# Altium schematic sheet 02_Analog.SchDoc
size A3
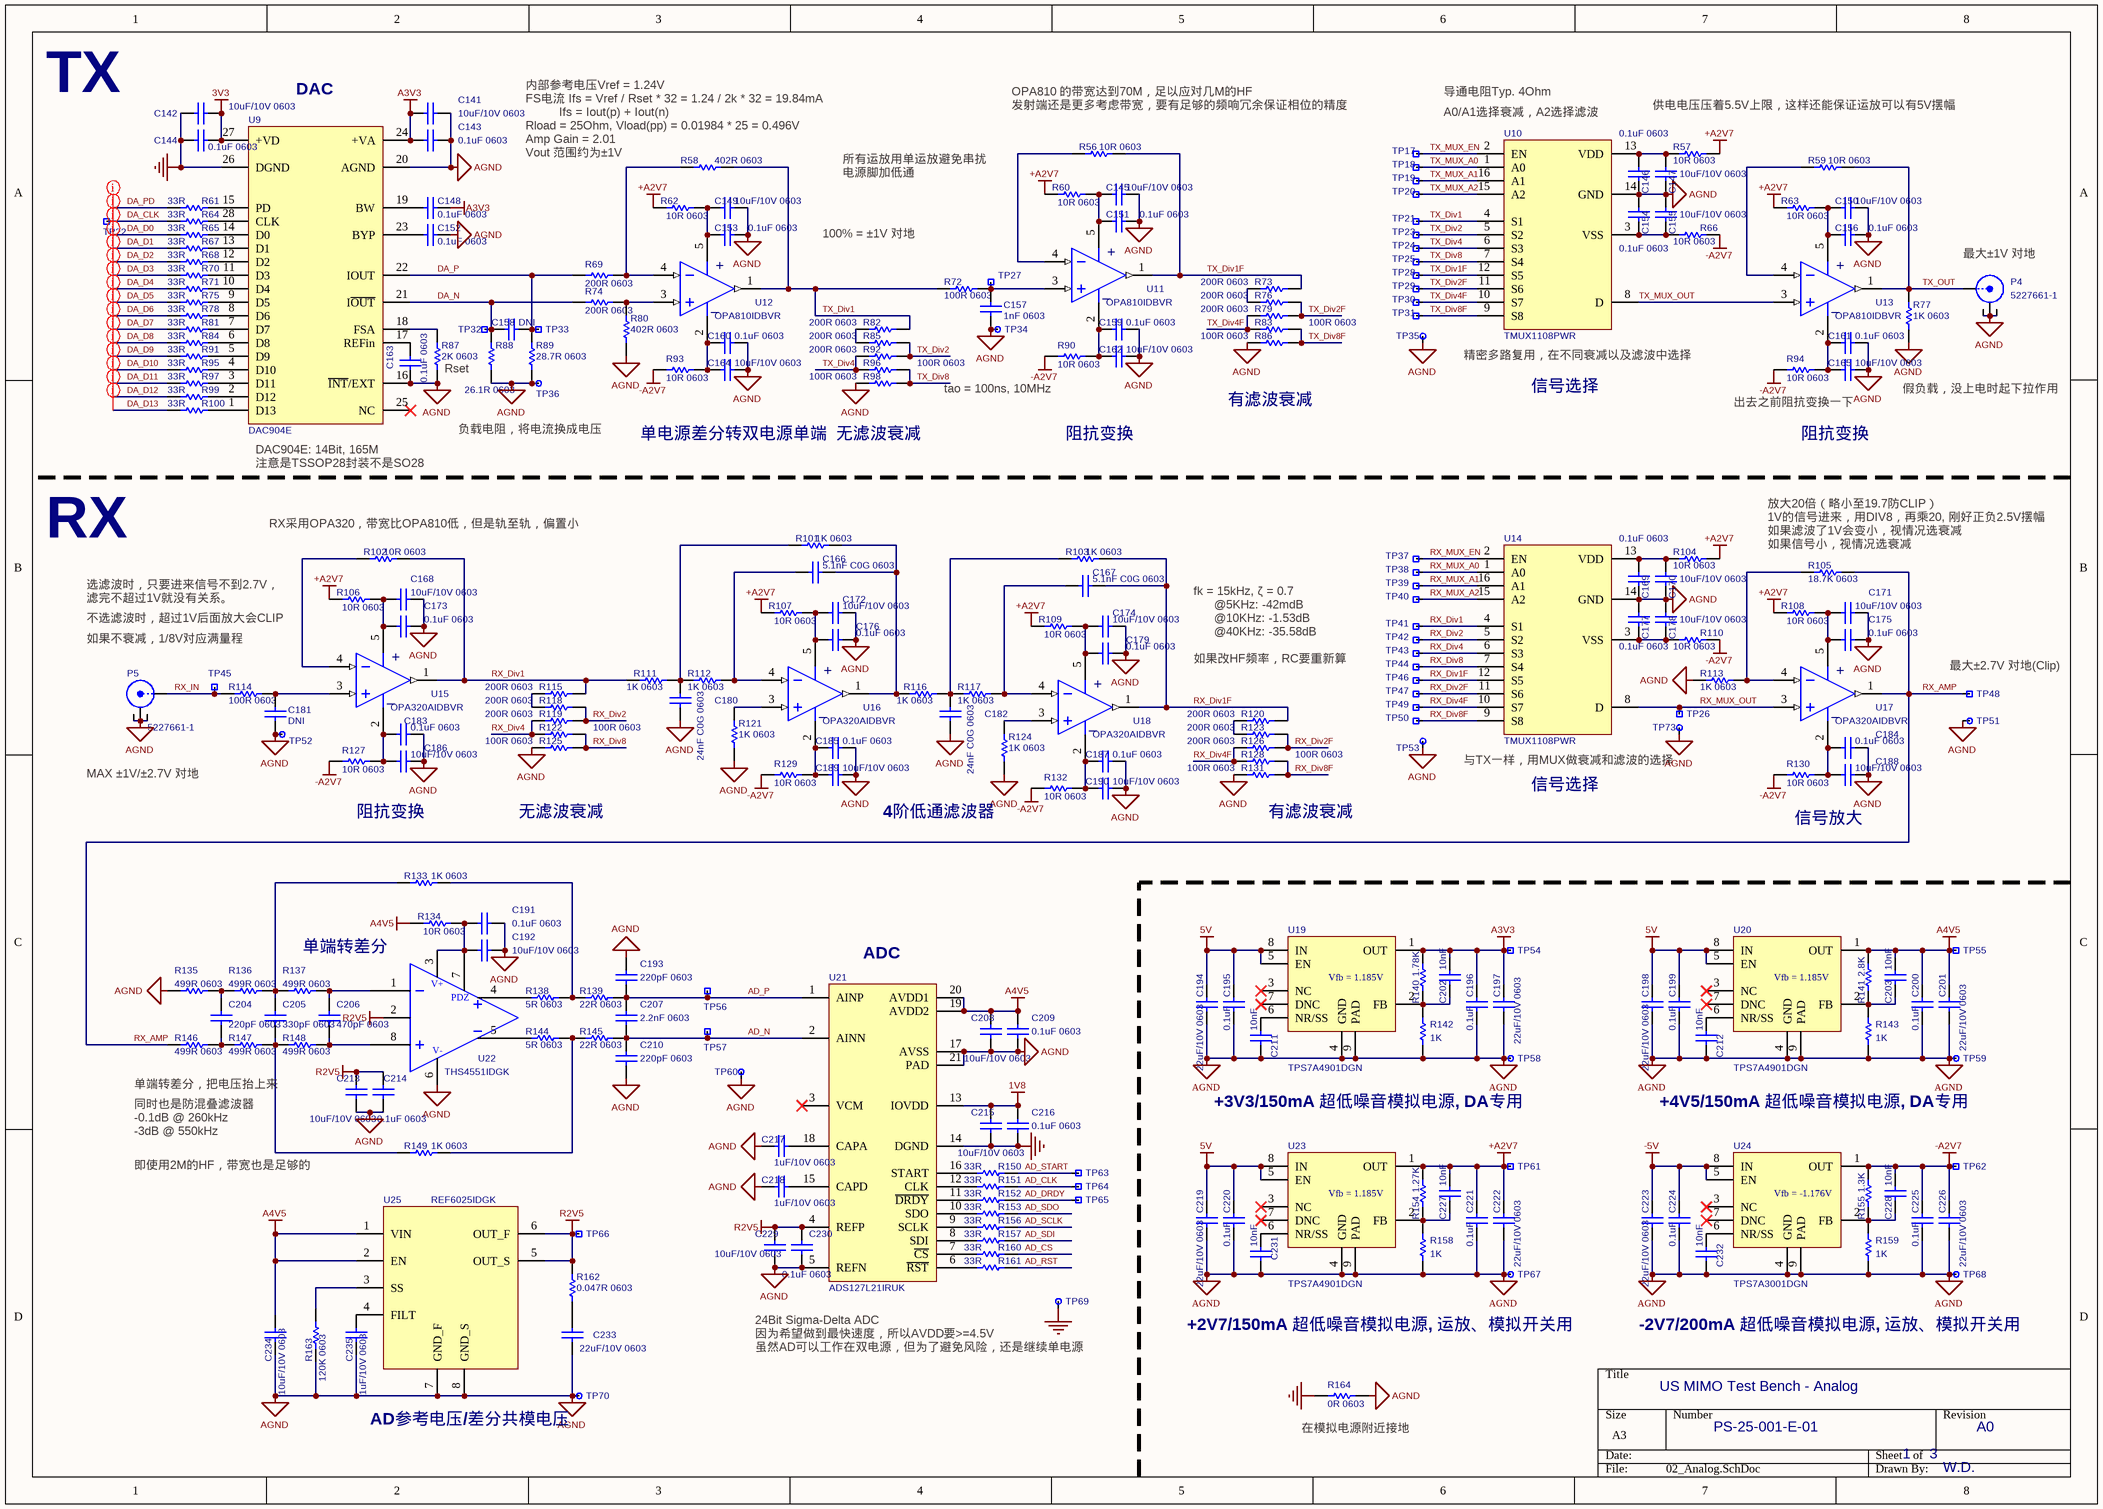
[diagram p0: 02_Analog.SchDoc]

## Parts
C141  10uF/10V 0603  [1608[0603]CAP]
C142  10uF/10V 0603  [1608[0603]CAP]
C143  0.1uF 0603  [1608[0603]CAP]
C144  0.1uF 0603  [1608[0603]CAP]
C145  10uF/10V 0603  [1608[0603]CAP]
C146  0.1uF 0603  [1608[0603]CAP]
C147  10uF/10V 0603  [1608[0603]CAP]
C148  0.1uF 0603  [1608[0603]CAP]
C149  10uF/10V 0603  [1608[0603]CAP]
C150  10uF/10V 0603  [1608[0603]CAP]
C151  0.1uF 0603  [1608[0603]CAP]
C152  0.1uF 0603  [1608[0603]CAP]
C153  0.1uF 0603  [1608[0603]CAP]
C154  0.1uF 0603  [1608[0603]CAP]
C155  10uF/10V 0603  [1608[0603]CAP]
C156  0.1uF 0603  [1608[0603]CAP]
C157  1nF 0603  [1608[0603]CAP]
C158  DNI  [1608[0603]CAP]
C159  0.1uF 0603  [1608[0603]CAP]
C160  0.1uF 0603  [1608[0603]CAP]
C161  0.1uF 0603  [1608[0603]CAP]
C162  10uF/10V 0603  [1608[0603]CAP]
C163  0.1uF 0603  [1608[0603]CAP]
C164  10uF/10V 0603  [1608[0603]CAP]
C165  10uF/10V 0603  [1608[0603]CAP]
C166  5.1nF C0G 0603  [1608[0603]CAP]
C167  5.1nF C0G 0603  [1608[0603]CAP]
C168  10uF/10V 0603  [1608[0603]CAP]
C169  0.1uF 0603  [1608[0603]CAP]
C170  10uF/10V 0603  [1608[0603]CAP]
C171  10uF/10V 0603  [1608[0603]CAP]
C172  10uF/10V 0603  [1608[0603]CAP]
C173  0.1uF 0603  [1608[0603]CAP]
C174  10uF/10V 0603  [1608[0603]CAP]
C175  0.1uF 0603  [1608[0603]CAP]
C176  0.1uF 0603  [1608[0603]CAP]
C177  0.1uF 0603  [1608[0603]CAP]
C178  10uF/10V 0603  [1608[0603]CAP]
C179  0.1uF 0603  [1608[0603]CAP]
C180  24nF C0G 0603  [1608[0603]CAP]
C181  DNI  [1608[0603]CAP]
C182  24nF C0G 0603  [1608[0603]CAP]
C183  0.1uF 0603  [1608[0603]CAP]
C184  0.1uF 0603  [1608[0603]CAP]
C185  0.1uF 0603  [1608[0603]CAP]
C186  10uF/10V 0603  [1608[0603]CAP]
C187  0.1uF 0603  [1608[0603]CAP]
C188  10uF/10V 0603  [1608[0603]CAP]
C189  10uF/10V 0603  [1608[0603]CAP]
C190  10uF/10V 0603  [1608[0603]CAP]
C191  0.1uF 0603  [1608[0603]CAP]
C192  10uF/10V 0603  [1608[0603]CAP]
C193  220pF 0603  [1608[0603]CAP]
C194  22uF/10V 0603  [1608[0603]CAP]
C195  0.1uF  [1005[0402]CAP]
C196  0.1uF  [1005[0402]CAP]
C197  22uF/10V 0603  [1608[0603]CAP]
C198  22uF/10V 0603  [1608[0603]CAP]
C199  0.1uF  [1005[0402]CAP]
C200  0.1uF  [1005[0402]CAP]
C201  22uF/10V 0603  [1608[0603]CAP]
C202  10nF  [1005[0402]CAP]
C203  10nF  [1005[0402]CAP]
C204  220pF 0603  [1608[0603]CAP]
C205  330pF 0603  [1608[0603]CAP]
C206  470pF 0603  [1608[0603]CAP]
C207  2.2nF 0603  [1608[0603]CAP]
C208  10uF/10V 0603  [1608[0603]CAP]
C209  0.1uF 0603  [1608[0603]CAP]
C210  220pF 0603  [1608[0603]CAP]
C211  10nF  [1005[0402]CAP]
C212  10nF  [1005[0402]CAP]
C213  10uF/10V 0603  [1608[0603]CAP]
C214  0.1uF 0603  [1608[0603]CAP]
C215  10uF/10V 0603  [1608[0603]CAP]
C216  0.1uF 0603  [1608[0603]CAP]
C217  1uF/10V 0603  [1608[0603]CAP]
C218  1uF/10V 0603  [1608[0603]CAP]
C219  22uF/10V 0603  [1608[0603]CAP]
C220  0.1uF  [1005[0402]CAP]
C221  0.1uF  [1005[0402]CAP]
C222  22uF/10V 0603  [1608[0603]CAP]
C223  22uF/10V 0603  [1608[0603]CAP]
C224  0.1uF  [1005[0402]CAP]
C225  0.1uF  [1005[0402]CAP]
C226  22uF/10V 0603  [1608[0603]CAP]
C227  10nF  [1005[0402]CAP]
C228  10nF  [1005[0402]CAP]
C229  10uF/10V 0603  [1608[0603]CAP]
C230  0.1uF 0603  [1608[0603]CAP]
C231  10nF  [1005[0402]CAP]
C232  10nF  [1005[0402]CAP]
C233  22uF/10V 0603  [1608[0603]CAP]
C234  10uF/10V 0603  [1608[0603]CAP]
C235  1uF/10V 0603  [1608[0603]CAP]
P4  5227661-1  [BNC_5227661-1]
P5  5227661-1  [BNC_5227661-1]
R56  10R 0603  [1608[0603]RES]
R57  10R 0603  [1608[0603]RES]
R58  402R 0603  [1608[0603]RES]
R59  10R 0603  [1608[0603]RES]
R60  10R 0603  [1608[0603]RES]
R61  33R  [1005[0402]RES]
R62  10R 0603  [1608[0603]RES]
R63  10R 0603  [1608[0603]RES]
R64  33R  [1005[0402]RES]
R65  33R  [1005[0402]RES]
R66  10R 0603  [1608[0603]RES]
R67  33R  [1005[0402]RES]
R68  33R  [1005[0402]RES]
R69  200R 0603  [1608[0603]RES]
R70  33R  [1005[0402]RES]
R71  33R  [1005[0402]RES]
R72  100R 0603  [1608[0603]RES]
R73  200R 0603  [1608[0603]RES]
R74  200R 0603  [1608[0603]RES]
R75  33R  [1005[0402]RES]
R76  200R 0603  [1608[0603]RES]
R77  1K 0603  [1608[0603]RES]
R78  33R  [1005[0402]RES]
R79  200R 0603  [1608[0603]RES]
R80  402R 0603  [1608[0603]RES]
R81  33R  [1005[0402]RES]
R82  200R 0603  [1608[0603]RES]
R83  100R 0603  [1608[0603]RES]
R84  33R  [1005[0402]RES]
R85  200R 0603  [1608[0603]RES]
R86  100R 0603  [1608[0603]RES]
R87  2K 0603  [1608[0603]RES]
R88  26.1R 0603  [1608[0603]RES]
R89  28.7R 0603  [1608[0603]RES]
R90  10R 0603  [1608[0603]RES]
R91  33R  [1005[0402]RES]
R92  200R 0603  [1608[0603]RES]
R93  10R 0603  [1608[0603]RES]
R94  10R 0603  [1608[0603]RES]
R95  33R  [1005[0402]RES]
R96  100R 0603  [1608[0603]RES]
R97  33R  [1005[0402]RES]
R98  100R 0603  [1608[0603]RES]
R99  33R  [1005[0402]RES]
R100  33R  [1005[0402]RES]
R101  1K 0603  [1608[0603]RES]
R102  10R 0603  [1608[0603]RES]
R103  1K 0603  [1608[0603]RES]
R104  10R 0603  [1608[0603]RES]
R105  18.7K 0603  [1608[0603]RES]
R106  10R 0603  [1608[0603]RES]
R107  10R 0603  [1608[0603]RES]
R108  10R 0603  [1608[0603]RES]
R109  10R 0603  [1608[0603]RES]
R110  10R 0603  [1608[0603]RES]
R111  1K 0603  [1608[0603]RES]
R112  1K 0603  [1608[0603]RES]
R113  1K 0603  [1608[0603]RES]
R114  100R 0603  [1608[0603]RES]
R115  200R 0603  [1608[0603]RES]
R116  1K 0603  [1608[0603]RES]
R117  1K 0603  [1608[0603]RES]
R118  200R 0603  [1608[0603]RES]
R119  200R 0603  [1608[0603]RES]
R120  200R 0603  [1608[0603]RES]
R121  1K 0603  [1608[0603]RES]
R122  100R 0603  [1608[0603]RES]
R123  200R 0603  [1608[0603]RES]
R124  1K 0603  [1608[0603]RES]
R125  100R 0603  [1608[0603]RES]
R126  200R 0603  [1608[0603]RES]
R127  10R 0603  [1608[0603]RES]
R128  100R 0603  [1608[0603]RES]
R129  10R 0603  [1608[0603]RES]
R130  10R 0603  [1608[0603]RES]
R131  100R 0603  [1608[0603]RES]
R132  10R 0603  [1608[0603]RES]
R133  1K 0603  [1608[0603]RES]
R134  10R 0603  [1608[0603]RES]
R135  499R 0603  [1608[0603]RES]
R136  499R 0603  [1608[0603]RES]
R137  499R 0603  [1608[0603]RES]
R138  5R 0603  [1608[0603]RES]
R139  22R 0603  [1608[0603]RES]
R140  1.78K  [1005[0402]RES]
R141  2.8K  [1005[0402]RES]
R142  1K  [1005[0402]RES]
R143  1K  [1005[0402]RES]
R144  5R 0603  [1608[0603]RES]
R145  22R 0603  [1608[0603]RES]
R146  499R 0603  [1608[0603]RES]
R147  499R 0603  [1608[0603]RES]
R148  499R 0603  [1608[0603]RES]
R149  1K 0603  [1608[0603]RES]
R150  33R  [1005[0402]RES]
R151  33R  [1005[0402]RES]
R152  33R  [1005[0402]RES]
R153  33R  [1005[0402]RES]
R154  1.27K  [1005[0402]RES]
R155  1.3K  [1005[0402]RES]
R156  33R  [1005[0402]RES]
R157  33R  [1005[0402]RES]
R158  1K  [1005[0402]RES]
R159  1K  [1005[0402]RES]
R160  33R  [1005[0402]RES]
R161  33R  [1005[0402]RES]
R162  0.047R 0603  [1608[0603]RES]
R163  120K 0603  [1608[0603]RES]
R164  0R 0603  [1608[0603]RES]
TP17  TP_P  [tpad_020_REC]  (value not drawn)
TP18  TP_P  [tpad_020_REC]  (value not drawn)
TP19  TP_P  [tpad_020_REC]  (value not drawn)
TP20  TP_P  [tpad_020_REC]  (value not drawn)
TP21  TP_P  [tpad_020_REC]  (value not drawn)
TP22  TP_P  [tpad_020_REC]  (value not drawn)
TP23  TP_P  [tpad_020_REC]  (value not drawn)
TP24  TP_P  [tpad_020_REC]  (value not drawn)
TP25  TP_P  [tpad_020_REC]  (value not drawn)
TP26  TP_P  [tpad_020_REC]  (value not drawn)
TP27  TP_P  [tpad_020_REC]  (value not drawn)
TP28  TP_P  [tpad_020_REC]  (value not drawn)
TP29  TP_P  [tpad_020_REC]  (value not drawn)
TP30  TP_P  [tpad_020_REC]  (value not drawn)
TP31  TP_P  [tpad_020_REC]  (value not drawn)
TP32  TP_P  [tpad_020_REC]  (value not drawn)
TP33  TP_P  [tpad_020_REC]  (value not drawn)
TP34  TP_N  [tpad_020]  (value not drawn)
TP35  TP_N  [tpad_020]  (value not drawn)
TP36  TP_N  [tpad_020]  (value not drawn)
TP37  TP_P  [tpad_020_REC]  (value not drawn)
TP38  TP_P  [tpad_020_REC]  (value not drawn)
TP39  TP_P  [tpad_020_REC]  (value not drawn)
TP40  TP_P  [tpad_020_REC]  (value not drawn)
TP41  TP_P  [tpad_020_REC]  (value not drawn)
TP42  TP_P  [tpad_020_REC]  (value not drawn)
TP43  TP_P  [tpad_020_REC]  (value not drawn)
TP44  TP_P  [tpad_020_REC]  (value not drawn)
TP45  TP_P  [tpad_020_REC]  (value not drawn)
TP46  TP_P  [tpad_020_REC]  (value not drawn)
TP47  TP_P  [tpad_020_REC]  (value not drawn)
TP48  TP_P  [tpad_020_REC]  (value not drawn)
TP49  TP_P  [tpad_020_REC]  (value not drawn)
TP50  TP_P  [tpad_020_REC]  (value not drawn)
TP51  TP_N  [tpad_020]  (value not drawn)
TP52  TP_N  [tpad_020]  (value not drawn)
TP53  TP_N  [tpad_020]  (value not drawn)
TP54  TP_P  [tpad_020_REC]  (value not drawn)
TP55  TP_P  [tpad_020_REC]  (value not drawn)
TP56  TP_P  [tpad_020_REC]  (value not drawn)
TP57  TP_P  [tpad_020_REC]  (value not drawn)
TP58  TP_N  [tpad_020]  (value not drawn)
TP59  TP_N  [tpad_020]  (value not drawn)
TP60  TP_N  [tpad_020]  (value not drawn)
TP61  TP_P  [tpad_020_REC]  (value not drawn)
TP62  TP_P  [tpad_020_REC]  (value not drawn)
TP63  TP_P  [tpad_020_REC]  (value not drawn)
TP64  TP_P  [tpad_020_REC]  (value not drawn)
TP65  TP_P  [tpad_020_REC]  (value not drawn)
TP66  TP_P  [tpad_020_REC]  (value not drawn)
TP67  TP_N  [tpad_020]  (value not drawn)
TP68  TP_N  [tpad_020]  (value not drawn)
TP69  TP_N  [tpad_020]  (value not drawn)
TP70  TP_N  [tpad_020]  (value not drawn)
TP73  TP_N  [tpad_020]  (value not drawn)
U9  DAC904E  [TSSOP28]
U10  TMUX1108PWR  [TSSOP16]
U11  OPA810IDBVR  [SOT23-5]
U12  OPA810IDBVR  [SOT23-5]
U13  OPA810IDBVR  [SOT23-5]
U14  TMUX1108PWR  [TSSOP16]
U15  OPA320AIDBVR  [SOT23-5]
U16  OPA320AIDBVR  [SOT23-5]
U17  OPA320AIDBVR  [SOT23-5]
U18  OPA320AIDBVR  [SOT23-5]
U19  TPS7A4901DGN  [HVSSOP8]
U20  TPS7A4901DGN  [HVSSOP8]
U21  ADS127L21IRUK  [WQFN20]
U22  THS4551IDGK  [VSSOP8]
U23  TPS7A4901DGN  [HVSSOP8]
U24  TPS7A3001DGN  [HVSSOP8]
U25  REF6025IDGK  [VSSOP8]

## Nets
1V8: C215.1 C216.1 U21.13(IOVDD)
3V3: C142.2 C144.1 U9.27(+VD)
5V: C194.1 C195.2 C198.1 C199.2 C219.1 C220.2 U19.5(EN) U19.8(IN) U20.5(EN) U20.8(IN) U23.5(EN) U23.8(IN)
+A2V7: C221.2 C222.1 C227.2 R57.2 R60.1 R62.1 R63.1 R104.2 R106.1 R107.1 R108.1 R109.1 R154.2 TP61.1(A2) U23.1(OUT)
-5V: C223.1 C224.2 U24.5(EN) U24.8(IN)
-A2V7: C225.2 C226.1 C228.2 R66.2 R90.1 R93.1 R94.1 R110.2 R127.1 R129.1 R130.1 R132.1 R155.2 TP62.1(A2) U24.1(OUT)
A3V3: C141.1 C143.2 C148.1 C196.2 C197.1 C202.2 R140.2 TP54.1(A2) U9.24(+VA) U19.1(OUT)
A4V5: C200.2 C201.1 C203.2 C208.1 C209.1 C234.1 R134.1 R141.2 TP55.1(A2) U20.1(OUT) U21.19(AVDD2) U21.20(AVDD1) U25.1(VIN) U25.2(EN)
AGND: C141.2 C143.1 C145.2 C146.2 C147.1 C149.2 C150.2 C151.1 C152.1 C153.1 C154.1 C155.2 C156.1 C157.2 C159.1 C160.1 C161.1 C162.2 C163.2 C164.2 C165.2 C168.2 C169.2 C170.1 C171.2 C172.2 C173.1 C174.2 C175.1 C176.1 C177.1 C178.2 C179.1 C180.1 C181.2 C182.1 C183.1 C184.1 C185.1 C186.2 C187.1 C188.2 C189.2 C190.2 C191.2 C192.2 C193.1 C194.2 C195.1 C196.1 C197.2 C198.2 C199.1 C200.1 C201.2 C208.2 C209.2 C210.2 C211.1 C212.1 C213.2 C214.2 C217.1 C218.1 C219.2 C220.1 C221.1 C222.2 C223.2 C224.1 C225.1 C226.2 C229.2 C230.2 C231.1 C232.1 C233.2 C234.2 C235.2 P4.2(Y) P4.3(Y) P4.4(Y) P5.2(Y) P5.3(Y) P5.4(Y) R77.2 R80.1 R86.2 R87.2 R88.2 R89.2 R98.2 R113.2 R121.2 R124.2 R125.2 R131.2 R135.1 R142.1 R143.1 R158.1 R159.1 R163.1 R164.1 TP34.1(A2) TP35.1(A2) TP36.1(A2) TP51.1(A2) TP52.1(A2) TP53.1(A2) TP58.1(A2) TP59.1(A2) TP60.1(A2) TP67.1(A2) TP68.1(A2) TP70.1(A2) TP73.1(A2) U9.16(~{INT}/EXT) U9.20(AGND) U10.14(GND) U14.14(GND) U19.4(GND) U19.9(PAD) U20.4(GND) U20.9(PAD) U21.5(REFN) U21.17(AVSS) U21.21(PAD) U22.6(VS-) U23.4(GND) U23.9(PAD) U24.4(GND) U24.9(PAD) U25.7(GND_F) U25.8(GND_S)
GND: C142.1 C144.2 C215.2 C216.2 R164.2 TP69.1(A2) U9.26(DGND) U21.14(DGND)
R2V5: C213.1 C214.1 C229.1 C230.1 R162.2 TP66.1(A2) U21.4(REFP) U22.2(VCOM) U25.5(OUT_S) U25.6(OUT_F)
AD_CLK: R151.1 TP64.1(A2)
AD_CS: R160.1
AD_DRDY: R152.1 TP65.1(A2)
AD_N: C207.2 C210.1 R145.2 TP57.1(A2) U21.2(AINN)
AD_P: C193.2 C207.1 R139.2 TP56.1(A2) U21.1(AINP)
AD_RST: R161.1
AD_SCLK: R156.1
AD_SDI: R157.1
AD_SDO: R153.1
AD_START: R150.1 TP63.1(A2)
DA_CLK: R64.2 TP22.1(A2)
DA_D0: R65.2
DA_D1: R67.2
DA_D2: R68.2
DA_D3: R70.2
DA_D4: R71.2
DA_D5: R75.2
DA_D6: R78.2
DA_D7: R81.2
DA_D8: R84.2
DA_D9: R91.2
DA_D10: R95.2
DA_D11: R97.2
DA_D12: R99.2
DA_D13: R100.2
DA_N: C158.2 R74.1 R88.1 TP32.1(A2) U9.21(I~{OUT})
DA_P: C158.1 R69.1 R89.1 TP33.1(A2) U9.22(IOUT)
DA_PD: R61.2
RX_AMP: R105.1 R146.1 TP48.1(A2) U17.1(OUT_A)
RX_Div1: R102.1 R111.2 R115.1 TP41.1(A2) U14.4(S1) U15.1(OUT_A)
RX_Div1F: C167.2 R103.1 R120.1 TP46.1(A2) U14.12(S5) U18.1(OUT_A)
RX_Div2: R118.1 R119.1 TP42.1(A2) U14.5(S2)
RX_Div2F: R123.1 R126.1 TP47.1(A2) U14.11(S6)
RX_Div4: R119.2 R122.2 TP43.1(A2) U14.6(S3)
RX_Div4F: R126.2 R128.2 TP49.1(A2) U14.10(S7)
RX_Div8: R122.1 R125.1 TP44.1(A2) U14.7(S4)
RX_Div8F: R128.1 R131.1 TP50.1(A2) U14.9(S8)
RX_IN: P5.1(X) R114.2 TP45.1(A2)
RX_MUX_A0: TP38.1(A2) U14.1(A0)
RX_MUX_A1: TP39.1(A2) U14.16(A1)
RX_MUX_A2: TP40.1(A2) U14.15(A2)
RX_MUX_EN: TP37.1(A2) U14.2(EN)
RX_MUX_OUT: TP26.1(A2) U14.8(D) U17.3(IN+)
TX_Div1: R58.1 R72.2 R82.1 TP21.1(A2) U10.4(S1) U12.1(OUT_A)
TX_Div1F: R56.1 R73.1 TP28.1(A2) U10.12(S5) U11.1(OUT_A)
TX_Div2: R85.1 R92.1 TP23.1(A2) U10.5(S2)
TX_Div2F: R76.1 R79.1 TP29.1(A2) U10.11(S6)
TX_Div4: R92.2 R96.2 TP24.1(A2) U10.6(S3)
TX_Div4F: R79.2 R83.2 TP30.1(A2) U10.10(S7)
TX_Div8: R96.1 R98.1 TP25.1(A2) U10.7(S4)
TX_Div8F: R83.1 R86.1 TP31.1(A2) U10.9(S8)
TX_MUX_A0: TP18.1(A2) U10.1(A0)
TX_MUX_A1: TP19.1(A2) U10.16(A1)
TX_MUX_A2: TP20.1(A2) U10.15(A2)
TX_MUX_EN: TP17.1(A2) U10.2(EN)
TX_MUX_OUT: U10.8(D) U13.3(IN+)
TX_OUT: P4.1(X) R59.1 R77.1 U13.1(OUT_A)
NetC145_1: C145.1 C151.2 R60.2 U11.5(V+)
NetC146_1: C146.1 C147.2 R57.1 U10.13(VDD)
NetC148_2: C148.2 U9.19(BW)
NetC149_1: C149.1 C153.2 R62.2 U12.5(V+)
NetC150_1: C150.1 C156.2 R63.2 U13.5(V+)
NetC152_2: C152.2 U9.23(BYP)
NetC154_2: C154.2 C155.1 R66.1 U10.3(VSS)
NetC157_1: C157.1 R72.1 TP27.1(A2) U11.3(IN+)
NetC159_2: C159.2 C162.1 R90.2 U11.2(V-)
NetC160_2: C160.2 C164.1 R93.2 U12.2(V-)
NetC161_2: C161.2 C165.1 R94.2 U13.2(V-)
NetC163_1: C163.1 U9.17(REFin)
NetC166_1: C166.1 R112.1 U16.4(IN-)
NetC166_2: C166.2 R101.1 R116.2 U16.1(OUT_A)
NetC167_1: C167.1 R117.1 U18.4(IN-)
NetC168_1: C168.1 C173.2 R106.2 U15.5(V+)
NetC169_1: C169.1 C170.2 R104.1 U14.13(VDD)
NetC171_1: C171.1 C175.2 R108.2 U17.5(V+)
NetC172_1: C172.1 C176.2 R107.2 U16.5(V+)
NetC174_1: C174.1 C179.2 R109.2 U18.5(V+)
NetC177_2: C177.2 C178.1 R110.1 U14.3(VSS)
NetC180_2: C180.2 R101.2 R111.1 R112.2
NetC181_1: C181.1 R114.1 U15.3(IN+)
NetC182_2: C182.2 R103.2 R116.1 R117.2
NetC183_2: C183.2 C186.1 R127.2 U15.2(V-)
NetC184_2: C184.2 C188.1 R130.2 U17.2(V-)
NetC185_2: C185.2 C189.1 R129.2 U16.2(V-)
NetC187_2: C187.2 C190.1 R132.2 U18.2(V-)
NetC191_1: C191.1 C192.1 R134.2 U22.3(VS+) U22.7(PDZ)
NetC202_1: C202.1 R140.1 R142.2 U19.2(FB)
NetC203_1: C203.1 R141.1 R143.2 U20.2(FB)
NetC204_1: C204.1 R135.2 R136.1
NetC204_2: C204.2 R146.2 R147.1
NetC205_1: C205.1 R133.1 R136.2 R137.1
NetC205_2: C205.2 R147.2 R148.1 R149.1
NetC206_1: C206.1 R137.2 U22.1(IN-)
NetC206_2: C206.2 R148.2 U22.8(IN+)
NetC211_2: C211.2 U19.6(NR/SS)
NetC212_2: C212.2 U20.6(NR/SS)
NetC217_2: C217.2 U21.18(CAPA)
NetC218_2: C218.2 U21.15(CAPD)
NetC227_1: C227.1 R154.1 R158.2 U23.2(FB)
NetC228_1: C228.1 R155.1 R159.2 U24.2(FB)
NetC231_2: C231.2 U23.6(NR/SS)
NetC232_2: C232.2 U24.6(NR/SS)
NetC233_1: C233.1 R162.1
NetC235_1: C235.1 U25.4(FILT)
NetR56_2: R56.2 U11.4(IN-)
NetR58_2: R58.2 R69.2 U12.4(IN-)
NetR59_2: R59.2 U13.4(IN-)
NetR61_1: R61.1 U9.15(PD)
NetR64_1: R64.1 U9.28(CLK)
NetR65_1: R65.1 U9.14(D0)
NetR67_1: R67.1 U9.13(D1)
NetR68_1: R68.1 U9.12(D2)
NetR70_1: R70.1 U9.11(D3)
NetR71_1: R71.1 U9.10(D4)
NetR73_2: R73.2 R76.2
NetR74_2: R74.2 R80.2 U12.3(IN+)
NetR75_1: R75.1 U9.9(D5)
NetR78_1: R78.1 U9.8(D6)
NetR81_1: R81.1 U9.7(D7)
NetR82_2: R82.2 R85.2
NetR84_1: R84.1 U9.6(D8)
NetR87_1: R87.1 U9.18(FSA)
NetR91_1: R91.1 U9.5(D9)
NetR95_1: R95.1 U9.4(D10)
NetR97_1: R97.1 U9.3(D11)
NetR99_1: R99.1 U9.2(D12)
NetR100_1: R100.1 U9.1(D13)
NetR102_2: R102.2 U15.4(IN-)
NetR105_2: R105.2 R113.1 U17.4(IN-)
NetR115_2: R115.2 R118.2
NetR120_2: R120.2 R123.2
NetR121_1: R121.1 U16.3(IN+)
NetR124_1: R124.1 U18.3(IN+)
NetR133_2: R133.2 R138.2 R139.1
NetR138_1: R138.1 U22.4(OUT+)
NetR144_1: R144.1 U22.5(OUT-)
NetR144_2: R144.2 R145.1 R149.2
NetR150_2: R150.2 U21.16(START)
NetR151_2: R151.2 U21.12(CLK)
NetR152_2: R152.2 U21.11(~{DRDY})
NetR153_2: R153.2 U21.10(SDO)
NetR156_2: R156.2 U21.9(SCLK)
NetR157_2: R157.2 U21.8(SDI)
NetR160_2: R160.2 U21.7(~{CS})
NetR161_2: R161.2 U21.6(~{RST})
NetR163_2: R163.2 U25.3(SS)

Not connected (* = marked no-connect by the designer): U9 25(NC)*; U19 3(NC)* 7(DNC)*; U20 3(NC)* 7(DNC)*; U21 3(VCM)*; U23 3(NC)* 7(DNC)*; U24 3(NC)* 7(DNC)*

## Layout directives
net class DA_DATA: DA_CLK, DA_D0, DA_D1, DA_D2, DA_D3, DA_D4, DA_D5, DA_D6, DA_D7, DA_D8, DA_D9, DA_D10, DA_D11, DA_D12, DA_D13, DA_PD

## Notes on the sheet
- TX
- (near U9) DAC
- 内部参考电压Vref = 1.24V
- FS电流 Ifs = Vref / Rset * 32 = 1.24 / 2k * 32 = 19.84mA
- OPA810 的带宽达到70M，足以应对几M的HF
- (near R56) 发射端还是更多考虑带宽，要有足够的频响冗余保证相位的精度
- 导通电阻Typ. 4Ohm
- 供电电压压着5.5V上限，这样还能保证运放可以有5V摆幅
- (near R58) Rload = 25Ohm, Vload(pp) = 0.01984 * 25 = 0.496V
- Amp Gain = 2.01
- Vout 范围约为±1V
- (near R58) Ifs = Iout(p) + Iout(n)
- 所有运放用单运放避免串扰
- 电源脚加低通
- A0/A1选择衰减，A2选择滤波
- 100% = ±1V 对地
- (near P4) 最大±1V 对地
- (near R87) Rset
- 精密多路复用，在不同衰减以及滤波中选择
- (near U9) DAC904E: 14Bit, 165M
- 负载电阻，将电流换成电压
- 单电源差分转双电源单端
- 无滤波衰减
- (near R90) tao = 100ns, 10MHz
- 阻抗变换
- 有滤波衰减
- 信号选择
- (near R94) 出去之前阻抗变换一下
- 假负载，没上电时起下拉作用
- 注意是TSSOP28封装不是SO28
- 放大20倍（略小至19.7防CLIP）
- RX
- 选滤波时，只要进来信号不到2.7V，
- (near R102) RX采用OPA320，带宽比OPA810低，但是轨至轨，偏置小
- 1V的信号进来，用DIV8，再乘20, 刚好正负2.5V摆幅
- (near R105) 如果滤波了1V会变小，视情况选衰减
- (near R105) 如果信号小，视情况选衰减
- 滤完不超过1V就没有关系。
- 不选滤波时，超过1V后面放大会CLIP
- 如果不衰减，1/8V对应满量程
- fk = 15kHz, ζ = 0.7
- @5KHz: -42mdB
- @10KHz: -1.53dB
- @40KHz: -35.58dB
- 如果改HF频率，RC要重新算
- (near TP48) 最大±2.7V 对地(Clip)
- MAX ±1V/±2.7V 对地
- 与TX一样，用MUX做衰减和滤波的选择
- 4阶低通滤波器
- 信号放大
- 单端转差分
- (near U21) ADC
- 单端转差分，把电压抬上来
- 同时也是防混叠滤波器
- -0.1dB @ 260kHz
- +3V3/150mA 超低噪音模拟电源, DA专用
- +4V5/150mA 超低噪音模拟电源, DA专用
- -3dB @ 550kHz
- 即使用2M的HF，带宽也是足够的
- 24Bit Sigma-Delta ADC
- 因为希望做到最快速度，所以AVDD要>=4.5V
- 虽然AD可以工作在双电源，但为了避免风险，还是继续单电源
- +2V7/150mA 超低噪音模拟电源, 运放、模拟开关用
- -2V7/200mA 超低噪音模拟电源, 运放、模拟开关用
- US MIMO Test Bench - Analog
- (near U25) AD参考电压/差分共模电压
- (near R164) 在模拟电源附近接地
- PS-25-001-E-01
- 1
- 3
- A0
- W.D.
- (in symbol LM7321MF) +; _
- (in symbol THS4551) V+; V-
- (in symbol TPS7A3001DGN) Vfb = -1.176V
- (in symbol TPS7A4901DGN) Vfb = 1.185V

## Library data of the parts
C141-C235 = Cap: Capacitor; Published: 8-Jun-2000; LatestRevisionDate: 17-Jul-2002; LatestRevisionNote: Re-released for DXP Platform.; PackageReference: RAD-0.3; Publisher: Altium Limited; PackageDescription: Radial Cap, Thru-Hole; 2 Leads; 0.3 in Pin Spacing
P4 P5 = BNC_TE: BNC Elbow Connector; LatestRevisionDate: 17-Jul-2002; LatestRevisionNote: Re-released for DXP Platform.; Publisher: Altium Limited
R56-R164 = Res1: Resistor; Published: 8-Jun-2000; LatestRevisionDate: 17-Jul-2002; LatestRevisionNote: Re-released for DXP Platform.; PackageReference: AXIAL-0.3; Publisher: Altium Limited; PackageDescription: Axial Device, Thru-Hole; 2 Leads; 0.3 in Pin Spacing
U11-U13 U15-U18 = LM7321MF: Op Amp
U21 = ADS127L21
U22 = THS4551
U25 = REF60xx